# Altium schematic sheet Filtro.SchDoc
size A4; SheetNumber: 2; SheetTotal: 2
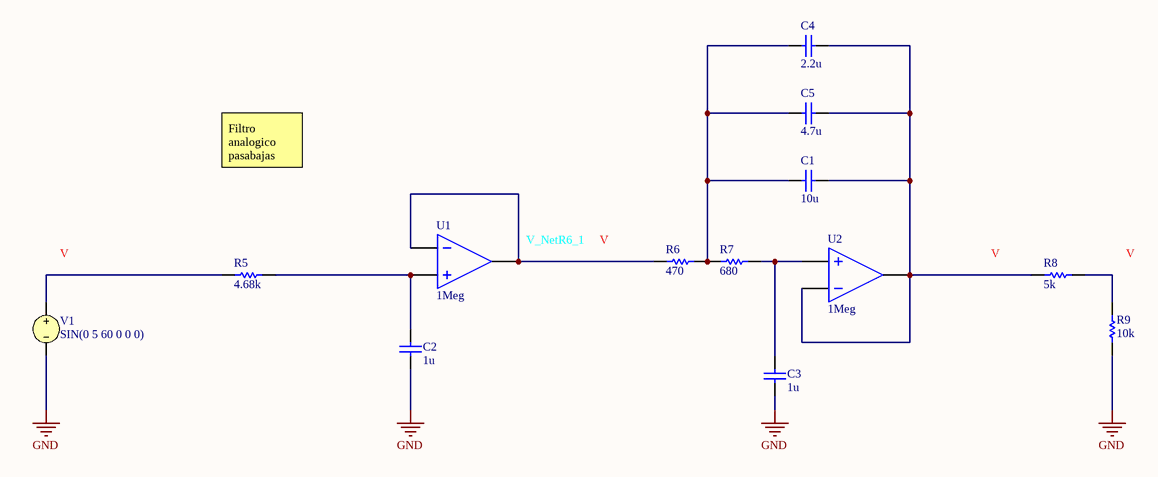
[diagram p0: Filtro.SchDoc]

## Parts
C1  value 10u  (hidden comment: Capacitor)
C2  value 1u  (hidden comment: Capacitor)
C3  value 1u  (hidden comment: Capacitor)
C4  value 2.2u  (hidden comment: Capacitor)
C5  value 4.7u  (hidden comment: Capacitor)
R5  value 4.68k  (hidden comment: Resistor)
R6  value 470  (hidden comment: Resistor)
R7  value 680  (hidden comment: Resistor)
R8  value 5k  (hidden comment: Resistor)
R9  value 10k  (hidden comment: Resistor)
U1  GAIN: 1Meg  (hidden comment: Ideal Operational Amplifier)
U2  GAIN: 1Meg  (hidden comment: Ideal Operational Amplifier)
V1  SIN(0 5 60 0 0 0)

## Nets
GND: C2.2 C3.2 R9.1 V1.2
NetC1_1: C1.1 C4.1 C5.1 R6.2 R7.1
NetC1_2: C1.2 C4.2 C5.2 R8.1 U2.1(IN-) U2.3(OUT)
NetC2_1: C2.1 R5.2 U1.2(IN+)
NetC3_1: C3.1 R7.2 U2.2(IN+)
NetR5_1: R5.1 V1.1
NetR6_1: R6.1 U1.1(IN-) U1.3(OUT)
NetR8_2: R8.2 R9.2

## Notes on the sheet
- Filtro analogico pasabajas

## Library data of the parts
C1-C5 = Capacitor: SimulationGenericComponent: True
R5-R9 = Resistor: TC1: 0; SimulationGenericComponent: True; TC2: 0
U1 U2 = OpAmp: SimulationGenericComponent: True
V1 = VSRC: Voltage Source; Note: PCB Footprint - Not required; AC Magnitude: 5; AC Phase: 0; Frequency: 60; Published: 8-Jun-2000; LatestRevisionDate: 17-Jul-2002; LatestRevisionNote: Re-released for DXP Platform.; PackageReference: Not Applicable; Publisher: Altium Limited; DC Magnitude: 5; Offset: 0; Amplitude: 5; Delay: 0; Damping Factor: 0; Phase: 0